# Altium project Stadium_Board.PrjPcb
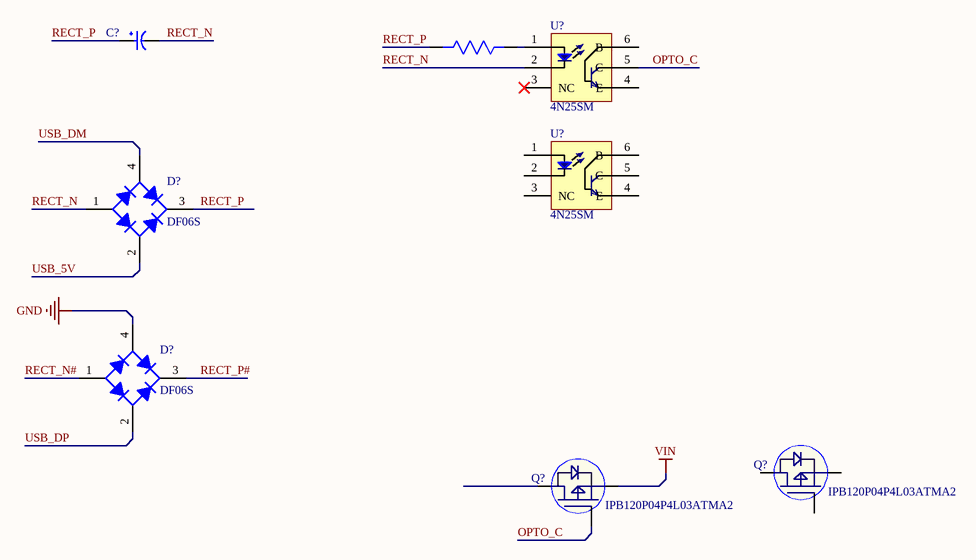
[diagram p0: Power_Section.SchDoc]
3 sheets, 10 parts. Net scope: global (net labels, ports and power ports of the same name join across sheets).
Sheets:
  Top_Sheet.SchDoc
  Power_Section.SchDoc
  Connector_Section.SchDoc

## Sheet Top_Sheet.SchDoc
size A4

## Sheet Power_Section.SchDoc
size A4

### Parts
(Parts that share a designator on the sheet are numbered #1, #2 ... from top to bottom, then left to right.)
C?  33uF  [VE-330M1ETR-0605]  (value not drawn)
D?#1  DF06S  [DF-S]
D?#2  DF06S  [DF-S]
Q?#1  IPB120P04P4L03ATMA2  [IPB120P04P4L03ATMA2]
Q?#2  IPB120P04P4L03ATMA2  [IPB120P04P4L03ATMA2]
R?  560R  [RES 1210]  (value not drawn)
U?#1  4N25SM  [4N25/35M]
U?#2  4N25SM  [4N25/35M]

### Nets
GND: D?#2.4(-)
VIN: Q?#2.3(S)
OPTO_C: Q?#2.1(G) U?#1.5(C)
RECT_N: C?.2 D?#1.1 U?#1.2(Ca)
RECT_N#: D?#2.1
RECT_P: C?.1 D?#1.3(+) R?.1
RECT_P#: D?#2.3(+)
USB_5V: D?#1.2
USB_DM: D?#1.4(-)
USB_DP: D?#2.2
NetR?_2: R?.2 U?#1.1(An)

Not connected (* = marked no-connect by the designer): Q?#1 1(G) 2_4(D) 3(S); Q?#2 2_4(D); U?#1 3(NC)* 4(E) 6(B); U?#2 1(An) 2(Ca) 3(NC) 4(E) 5(C) 6(B)

### Library data of the parts
C? = VE-330M1ETR-0605: Aluminum Electrolytic Capacitors - SMD 25 Volts 33uF 20% 6.3x5.3; Manufacturer: Lelon; Ripple Current: 67mA; Voltage Rating: 25V; Leakage Current: 3uA; Life (Hours): 2000Hour; Dissipation Factor: 0.14%; Supplier 1: Arrow Electronics; Manufacturer Part Number: VE-330M1ETR-0605; RoHS: Yes; Category: Aluminum Electrolytic Capacitors; Stock 1: 3000; Pricing 1: 1000=0.14450, 2000=0.13080, 4000=0.10990, 5000=0.10190, 10000=0.09820, 25000=0.09440 (USD); Case/Package: Aluminum; Min Operating Temperature: -40°C; Max Operating Temperature: 85°C; Tolerance: 20%; Capacitance: 33uF; Packaging: Tape and Reel; Package Quantity: 1000; Voltage Rating (DC): 25V; Termination: SMD/SMT; Series: VE; Construction: Cylindrical; Length: 5.3mm; Height: 6.6mm; Radiation Hardening: No; RoHS Compliant: Yes; ComponentLink1URL: https://www.verical.com/server-webapp/html/getDatasheet?partID=686789&src-supplier=Verical; ComponentLink1Description: https://www.verical.com/server-webapp/html/getDatasheet?partID=686789&src-supplier=Verical; ComponentLink2URL: http://components.arrow.com/part/dataview/0323_04207400?src-supplier=Arrow+Europe; ComponentLink2Description: http://components.arrow.com/part/dataview/0323_04207400?src-supplier=Arrow+Europe; ComponentLink3URL: http://www.lelon.com.tw/down.php?f=/file/7.pdf&n=VE.pdf&src-supplier=Mouser; ComponentLink3Description: http://www.lelon.com.tw/down.php?f=/file/7.pdf&n=VE.pdf&src-supplier=Mouser; Supplier Part Number 1: VE330M1ETR0605
D?#1 D?#2 = DF06S: BRIDGE RECT 1PHASE 600V 1A DF-S; Manufacturer: ON Semiconductor / Fairchild; Forward Voltage: 1.1V; Peak Reverse Current: 5uA; Peak Non-Repetitive Surge Current: 50A; Element Configuration: Single; Number of Elements: 1; Forward Current: 1.5A; Capacitance: 1nF; Max Reverse Leakage Current: 50uA; Tolerance: 5%; Voltage Rating: 100V; Power Dissipation: 3.1W; Supplier 1: Digi-Key; Manufacturer Part Number: DF06S; Stock 1: 3050; Pricing 1: 1=0.5, 10=0.425, 25=0.3964, 100=0.2946, 500=0.23 (USD); Mount: Through Hole; Case/Package: SMD/SMT; Number of Pins: 4; Weight: 0.484g; Case Code (Metric): 1608; Case Code (Imperial): 0603; Min Operating Temperature: -55°C; Max Operating Temperature: 150°C; Packaging: Tape and Reel; Max Repetitive Reverse Voltage (Vrrm): 600V; Max Surge Current: 50A; Package Quantity: 10000; Current Rating: 1.5A; Voltage Rating (DC): 600V; Output Current: 1.5A; Max Forward Surge Current (Ifsm): 50A; Average Rectified Current: 1.5A; Termination: SMD/SMT; Max Power Dissipation: 3.1W; Length: 0.063inch; Height: 3.3mm; Width: 6.5mm; Thickness: 0.035inch; Radiation Hardening: No; Lead Free: Lead Free; REACH SVHC: No SVHC; ComponentLink1URL: http://www.farnell.com/datasheets/2161293.pdf?src-supplier=Element14; ComponentLink1Description: http://www.farnell.com/datasheets/2161293.pdf?src-supplier=Element14; ComponentLink2URL: https://www.fairchildsemi.com/datasheets/DF/DF08S.pdf?src-supplier=Avnet; ComponentLink2Description: https://www.fairchildsemi.com/datasheets/DF/DF08S.pdf?src-supplier=Avnet; ComponentLink3URL: http://www.fairchildsemi.com/ds/DF/DF08S.pdf?src-supplier=Avnet+Europe; ComponentLink3Description: http://www.fairchildsemi.com/ds/DF/DF08S.pdf?src-supplier=Avnet+Europe; ComponentLink4URL: http://www.fairchildsemi.com/ds/DF/DF06S.pdf?src-supplier=Future+Electronics; ComponentLink4Description: http://www.fairchildsemi.com/ds/DF/DF06S.pdf?src-supplier=Future+Electronics; ComponentLink5URL: https://www.fairchildsemi.com/datasheets/DF/DF005S.pdf?src-supplier=Digi-Key; ComponentLink5Description: https://www.fairchildsemi.com/datasheets/DF/DF005S.pdf?src-supplier=Digi-Key; ComponentLink6URL: http://www.mouser.com/ds/2/149/DF06S-190284.pdf?src-supplier=Mouser; ComponentLink6Description: http://www.mouser.com/ds/2/149/DF06S-190284.pdf?src-supplier=Mouser; ComponentLink7URL: http://datasheet.iiic.cc/fairchild/DF06S.pdf?src-supplier=IIIC; ComponentLink7Description: http://datasheet.iiic.cc/fairchild/DF06S.pdf?src-supplier=IIIC; Supplier Part Number 1: DF06SCT-ND
Q?#1 Q?#2 = IPB120P04P4L03ATMA2: MOSFET P-CH 40V 120A TO263-3; Manufacturer: Infineon; Manufacturer Part Number: IPB120P04P4L-03; Rise Time: 16ns; Rds On Max: 3.1mR; Max Dual Supply Voltage: -40V; Gate to Source Voltage (Vgs): 16V; Fall Time: 57ns; Turn-Off Delay Time: 85ns; Max Power Dissipation: 136W; Turn-On Delay Time: 21ns; Input Capacitance: 11.38nF; Element Configuration: Single; Supplier 1: Digi-Key; RoHS: Yes; Category: MOSFETs; Pricing 1: 1=3.19000, 10=2.86100, 100=2.34420, 500=2.00360 (USD); Case/Package: TO-263-3; Number of Pins: 3; Min Operating Temperature: -55°C; Max Operating Temperature: 175°C; Packaging: Tape and Reel; Drain to Source Voltage (Vdss): -40V; Continuous Drain Current (ID): 120A; Drain to Source Resistance: 3.1mR; Power Dissipation: 136W; Drain to Source Breakdown Voltage: -40V; Length: 10mm; Width: 9.25mm; Height: 4.4mm; Halogen Free: Halogen Free; RoHS Compliant: Yes; REACH SVHC: No SVHC; ComponentLink1URL: http://www.infineon.com/dgdl/Infineon-IPP_B_I120P04P4L_03-DS-v01_00-en.pdf?fileId=db3a30432f69f146012f783b3b5a2e3f&ack=t&src-supplier=Avnet; ComponentLink1Description: http://www.infineon.com/dgdl/Infineon-IPP_B_I120P04P4L_03-DS-v01_00-en.pdf?fileId=db3a30432f69f146012f783b3b5a2e3f&ack=t&src-supplier=Avnet; ComponentLink2URL: http://www.infineon.com/dgdl/Infineon-IPP_B_I120P04P4L_03-DS-v01_00-en.pdf?fileId=db3a30432f69f146012f783b3b5a2e3f&ack=t&src-supplier=Avnet+Europe; ComponentLink2Description: http://www.infineon.com/dgdl/Infineon-IPP_B_I120P04P4L_03-DS-v01_00-en.pdf?fileId=db3a30432f69f146012f783b3b5a2e3f&ack=t&src-supplier=Avnet+Europe; ComponentLink3URL: http://www.farnell.com/datasheets/2018448.pdf?src-supplier=Element14; ComponentLink3Description: http://www.farnell.com/datasheets/2018448.pdf?src-supplier=Element14; Supplier Part Number 1: 448-IPB120P04P4L03ATMA2DKR-ND
R? = RC1210FR-07560RL: RES 560 OHM 1% 1/2W 1210; Manufacturer: Yageo; Power Rating: 500mW; Voltage Rating: 200V; Temperature Coefficient: 100ppm/°C; Supplier 1: Digi-Key; Manufacturer Part Number: RC1210FR-07560RL; RoHS: Yes; Category: Chip SMD Resistors; Pricing 1: 1=0.17000, 10=0.14900, 100=0.05740, 1000=0.02525, 2500=0.02181 (USD); Case/Package: 1210; Case Code (Imperial): 1210; Case Code (Metric): 3225; Size Code: 1210; Min Operating Temperature: -55°C; Max Operating Temperature: 155°C; Tolerance: 1%; Packaging: Tape and Reel; Resistance: 560R; Resistor Type: Thick Film; Termination: SMD/SMT; Number of Terminations: 2; Max Power Dissipation: 500mW; Features: Moisture Resistant; Series: RC; Construction: Rectangular; Length: 3.1mm; Width: 2.6mm; Height: 0.024inch; Depth: 2.6mm; Military Standard: Not; Lead Free: Lead Free; RoHS Compliant: Yes; ComponentLink1URL: https://datasheet.ciiva.com/12575/pyu-rc1210-51-rohs-l-4-12575621.pdf?src-supplier=Mouser; ComponentLink1Description: https://datasheet.ciiva.com/12575/pyu-rc1210-51-rohs-l-4-12575621.pdf?src-supplier=Mouser; Supplier Part Number 1: 13-RC1210FR-07560RLCT-ND
U?#1 U?#2 = 4N25SM: Opto Coupler General Purpose 6 Pin DIP Photo Transistor; Manufacturer: ON Semiconductor / Fairchild; Manufacturer Part Number: 4N25S-M; Forward Voltage: 1.5V; Number of Channels: 1; Collector Emitter Voltage (VCEO): 500mV; Max Output Voltage: 30V; Max Power Dissipation: 150mW; Reverse Breakdown Voltage: 6V; Forward Current: 60mA; Power Dissipation: 250mW; Max Collector Current: 50nA; Isolation Voltage: 7.5kV; Rise Time: 2us; Element Configuration: Single; Input Current: 10mA; Input Type: DC; Additional Feature: UL RECOGNIZED; Supplier 1: Avnet; RoHS: Yes; Category: Optocouplers; Stock 1: 3182; Pricing 1: 1000=0.21948, 1100=0.21355, 2100=0.20762, 5000=0.20169, 10000=0.19576, 50000=0.18982, 100000=0.18389 (USD); Mount: Surface Mount; Case/Package: SMD/SMT; Number of Pins: 6; Weight: 0.81g; Contact Plating: Tin,Matte; Terminal Finish: Tin; Min Operating Temperature: -40°C; Max Operating Temperature: 100°C; Packaging: Bulk; Package Quantity: 1000; Output Voltage: 30V; Collector Emitter Saturation Voltage: 500mV; Reverse Voltage (DC): 6V; Max Input Current: 60mA; Number of Elements: 1; Fall Time: 2us; Number of Circuits: 1; Series: -; Collector-emitter Voltage-Max: 500mV; Number of Functions: 1; Isolation Voltage-Max: 7.5kV; Radiation Hardening: No; RoHS Compliant: Yes; REACH SVHC: No SVHC; Lead Free: Lead Free; ComponentLink1URL: https://datasheet.ciiva.com/16746/4n25sm-16746231.pdf?src-supplier=Future+Electronics; ComponentLink1Description: https://datasheet.ciiva.com/16746/4n25sm-16746231.pdf?src-supplier=Future+Electronics; ComponentLink2URL: https://datasheet.ciiva.com/19453/1201795-19453506.pdf?src-supplier=Jameco; ComponentLink2Description: https://datasheet.ciiva.com/19453/1201795-19453506.pdf?src-supplier=Jameco; ComponentLink3URL: https://datasheet.ciiva.com/15118/getdatasheetpartid-60638-15118453.pdf?src-supplier=Verical; ComponentLink3Description: https://datasheet.ciiva.com/15118/getdatasheetpartid-60638-15118453.pdf?src-supplier=Verical; ComponentLink4URL: https://datasheet.ciiva.com/1246/683405-1246957.pdf?src-supplier=Element14; ComponentLink4Description: https://datasheet.ciiva.com/1246/683405-1246957.pdf?src-supplier=Element14; ComponentLink5URL: https://datasheet.ciiva.com/1246/683405-1246958.pdf?src-supplier=Element14; ComponentLink5Description: https://datasheet.ciiva.com/1246/683405-1246958.pdf?src-supplier=Element14; ComponentLink6URL: https://datasheet.ciiva.com/2087/4n25m-2087542.pdf?src-supplier=Digi-Key; ComponentLink6Description: https://datasheet.ciiva.com/2087/4n25m-2087542.pdf?src-supplier=Digi-Key; ComponentLink7URL: https://datasheet.ciiva.com/8084/4n25m-8084950.pdf?src-supplier=Avnet; ComponentLink7Description: https://datasheet.ciiva.com/8084/4n25m-8084950.pdf?src-supplier=Avnet; Supplier Part Number 1: 4N25SM

## Sheet Connector_Section.SchDoc
size A4
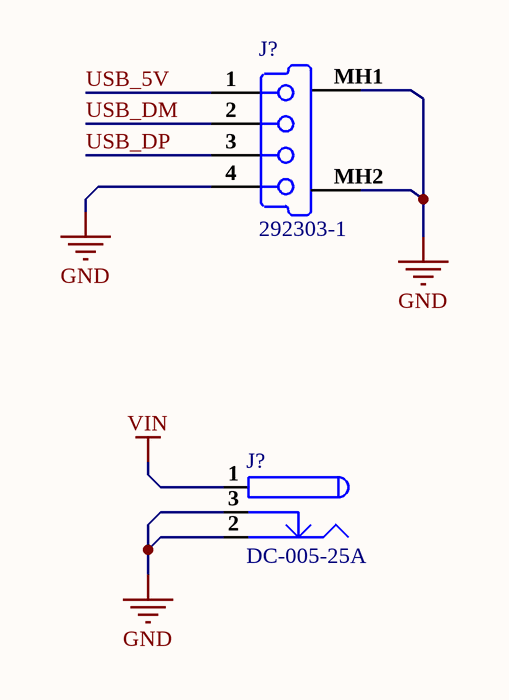
[diagram p1: Connector_Section.SchDoc]

### Parts
(Parts that share a designator on the sheet are numbered #1, #2 ... from top to bottom, then left to right.)
J?#1  292303-1  [292303-1]
J?#2  DC-005-25A  [DC-005-25A]

### Nets
GND: J?#1.4(NC) J?#1.MH1(Tab) J?#1.MH2(Tab) J?#2.2 J?#2.3
VIN: J?#2.1
USB_5V: J?#1.1(V_BUS_(5V))
USB_DM: J?#1.2(D-)
USB_DP: J?#1.3(D+)

### Library data of the parts
J?#1 = 292303-1: USB-A (USB TYPE-A) USB 2.0 Receptacle Connector 4 Position Through Hole, Right Angle; Manufacturer: TE Connectivity; Plating: Bright,Tin; Number of Positions: 4; Number of Ports: 1; Plating Thickness: 0.76um; Contact Current Rating: 1A; Circuit Application: Signal; Connector System: Cable-to-Board; USB Standard: USB 2.0; Insulation Resistance: 1GR; Voltage Rating (AC): 30V; Pitch: 2.5mm; PCB Thickness: 0.062inch; Tail Length: 0.112inch; Approvals: UL; Supplier 1: Digi-Key; Manufacturer Part Number: 292303-1; Stock 1: 19088; Pricing 1: 1=1.49, 10=1.354, 25=1.2716, 50=1.2162, 100=1.161, 250=1.0504, 500=0.96748, 1000=0.82926, 2500=0.77398 (USD); Mount: Through Hole,Horizontal; Contact Plating: Gold; Housing Material: Thermoplastic; Housing Color: Black; Contact Material: Copper Alloy,Copper; Number of Terminals: 4; Color: Black; Min Operating Temperature: -67°C; Max Operating Temperature: 185°C; Packaging: Rail/Tube; Package Quantity: 30; Termination: Through Hole; Gender: Receptacle; Connector Type: Receptacle; Orientation: Right Angle; Number of Contacts: 4; Current Rating: 1A; Length: 14.63mm; Depth: 14mm; REACH SVHC: No SVHC; Flammability Rating: UL94 V-0; Halogen Free: Halogen Free; ComponentLink1URL: http://www.farnell.com/datasheets/1699414.pdf?src-supplier=Farnell; ComponentLink1Description: http://www.farnell.com/datasheets/1699414.pdf?src-supplier=Farnell; ComponentLink2URL: http://www.te.com/commerce/DocumentDelivery/DDEController?Action=showdoc&DocId=Data+Sheet%7F1-1773453-6%7F0908%7Fpdf%7FEnglish%7FENG_DS_1-1773453-6_0908.pdf&src-supplier=Avnet; ComponentLink2Description: http://www.te.com/commerce/DocumentDelivery/DDEController?Action=showdoc&DocId=Data+Sheet%7F1-1773453-6%7F0908%7Fpdf%7FEnglish%7FENG_DS_1-1773453-6_0908.pdf&src-supplier=Avnet; ComponentLink3URL: http://www.te.com/commerce/DocumentDelivery/DDEController?Action=showdoc&DocId=Data+Sheet1-1773453-60908pdfEnglishENG_DS_1-1773453-6_0908.pdf&src-supplier=Avnet+Asia; ComponentLink3Description: http://www.te.com/commerce/DocumentDelivery/DDEController?Action=showdoc&DocId=Data+Sheet1-1773453-60908pdfEnglishENG_DS_1-1773453-6_0908.pdf&src-supplier=Avnet+Asia; ComponentLink4URL: https://www.te.com/commerce/DocumentDelivery/DDEController?Action=srchrtrv&DocNm=292303&DocType=Customer+Drawing&DocLang=English&src-supplier=Digi-Key; ComponentLink4Description: https://www.te.com/commerce/DocumentDelivery/DDEController?Action=srchrtrv&DocNm=292303&DocType=Customer+Drawing&DocLang=English&src-supplier=Digi-Key; ComponentLink5URL: http://www.farnell.com/datasheets/1699414.pdf?src-supplier=Element14; ComponentLink5Description: http://www.farnell.com/datasheets/1699414.pdf?src-supplier=Element14; ComponentLink6URL: http://www.farnell.com/cad/1699210.pdf?src-supplier=Element14; ComponentLink6Description: http://www.farnell.com/cad/1699210.pdf?src-supplier=Element14; ComponentLink7URL: https://www.alliedelec.com/m/d/b8ff6cd1157c72c7c4c41b4704d2a2e6.pdf?src-supplier=Allied+Electronics; ComponentLink7Description: https://www.alliedelec.com/m/d/b8ff6cd1157c72c7c4c41b4704d2a2e6.pdf?src-supplier=Allied+Electronics; ComponentLink8URL: http://www.te.com/commerce/DocumentDelivery/DDEController?Action=showdoc&DocId=Data+Sheet%7F1-1773453-6%7F0908%7Fpdf%7FEnglish%7FENG_DS_1-1773453-6_0908.pdf&src-supplier=Avnet+Europe; ComponentLink8Description: http://www.te.com/commerce/DocumentDelivery/DDEController?Action=showdoc&DocId=Data+Sheet%7F1-1773453-6%7F0908%7Fpdf%7FEnglish%7FENG_DS_1-1773453-6_0908.pdf&src-supplier=Avnet+Europe; ComponentLink9URL: https://www.distrelec.biz/Web/Downloads/07/08/04270708.pdf?mime=application%2Fpdf&src-supplier=Distrelec; ComponentLink9Description: https://www.distrelec.biz/Web/Downloads/07/08/04270708.pdf?mime=application%2Fpdf&src-supplier=Distrelec; ComponentLink10URL: http://www.jameco.com/Jameco/Products/ProdDS/921651.pdf?src-supplier=Jameco; ComponentLink10Description: http://www.jameco.com/Jameco/Products/ProdDS/921651.pdf?src-supplier=Jameco; ComponentLink11URL: http://www.onlinecomponents.com/productFiles/mf-AMP/ddecontrolleractionsrchrtrvdocnm117734536doctypedsdoclan.pdf?src-supplier=Onlinecomponents.com; ComponentLink11Description: http://www.onlinecomponents.com/productFiles/mf-AMP/ddecontrolleractionsrchrtrvdocnm117734536doctypedsdoclan.pdf?src-supplier=Onlinecomponents.com; ComponentLink12URL: http://www.te.com/commerce/DocumentDelivery/DDEController?Action=showdoc&DocId=Customer+Drawing%7F292303%7FE7%7Fpdf%7FEnglish%7FENG_CD_292303_E7.pdf%7F292303-1&src-supplier=Future+Electronics; ComponentLink12Description: http://www.te.com/commerce/DocumentDelivery/DDEController?Action=showdoc&DocId=Customer+Drawing%7F292303%7FE7%7Fpdf%7FEnglish%7FENG_CD_292303_E7.pdf%7F292303-1&src-supplier=Future+Electronics; Supplier Part Number 1: A31726-ND
J?#2 = DC-005-25A: 500mA Jack DCPowerReceptacle 6.4mm 2.5mm 14.2*9.0mm AC/DC Power Connectors ROHS; Manufacturer: Korean Hroparts Elec; Value: Custom; Manufacturer Part No: DC-005-25A; Package: Custom

## Nets that join several sheets
GND: Power_Section (D?#2.4), Connector_Section (5 pins)
VIN: Power_Section (Q?#2.3), Connector_Section (J?#2.1)
USB_5V: Power_Section (D?#1.2), Connector_Section (J?#1.1)
USB_DM: Power_Section (D?#1.4), Connector_Section (J?#1.2)
USB_DP: Power_Section (D?#2.2), Connector_Section (J?#1.3)